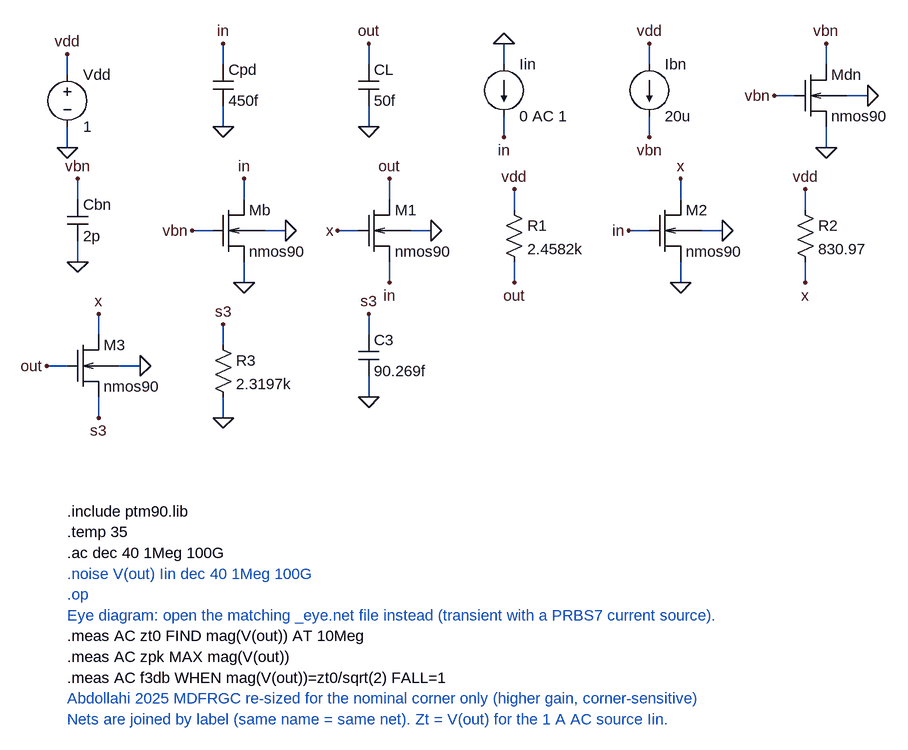
[diagram p0: schematic base_mdfrgc_nominal.asc]
base_mdfrgc_nominal.asc, the LTspice schematic file:
Version 4
SHEET 1 1600 1400
WIRE 0 16 0 -16
WIRE 0 96 0 128
WIRE 240 0 240 -32
WIRE 240 64 240 96
WIRE 464 0 464 -32
WIRE 464 64 464 96
WIRE 672 0 672 -32
WIRE 672 80 672 112
WIRE 896 0 896 -32
WIRE 896 80 896 112
WIRE 1168 0 1168 -32
WIRE 1120 48 1088 48
WIRE 1168 96 1168 128
WIRE 1200 48 1232 48
WIRE 16 208 16 176
WIRE 16 272 16 304
WIRE 272 208 272 176
WIRE 224 256 192 256
WIRE 272 304 272 336
WIRE 304 256 336 256
WIRE 496 208 496 176
WIRE 448 256 416 256
WIRE 496 304 496 336
WIRE 528 256 560 256
WIRE 688 224 688 192
WIRE 688 304 688 336
WIRE 944 208 944 176
WIRE 896 256 864 256
WIRE 944 304 944 336
WIRE 976 256 1008 256
WIRE 1136 224 1136 192
WIRE 1136 304 1136 336
WIRE 48 416 48 384
WIRE 0 464 -32 464
WIRE 48 512 48 544
WIRE 80 464 112 464
WIRE 240 432 240 400
WIRE 240 512 240 544
WIRE 464 416 464 384
WIRE 464 480 464 512
FLAG 0 -16 vdd
FLAG 0 128 0
FLAG 240 -32 in
FLAG 240 96 0
FLAG 464 -32 out
FLAG 464 96 0
FLAG 672 -32 0
FLAG 672 112 in
FLAG 896 -32 vdd
FLAG 896 112 vbn
FLAG 1168 -32 vbn
FLAG 1088 48 vbn
FLAG 1168 128 0
FLAG 1232 48 0
FLAG 16 176 vbn
FLAG 16 304 0
FLAG 272 176 in
FLAG 192 256 vbn
FLAG 272 336 0
FLAG 336 256 0
FLAG 496 176 out
FLAG 416 256 x
FLAG 496 336 in
FLAG 560 256 0
FLAG 688 192 vdd
FLAG 688 336 out
FLAG 944 176 x
FLAG 864 256 in
FLAG 944 336 0
FLAG 1008 256 0
FLAG 1136 192 vdd
FLAG 1136 336 x
FLAG 48 384 x
FLAG -32 464 out
FLAG 48 544 s3
FLAG 112 464 0
FLAG 240 400 s3
FLAG 240 544 0
FLAG 464 384 s3
FLAG 464 512 0
SYMBOL voltage 0 0 R0
SYMATTR InstName Vdd
SYMATTR Value 1
SYMBOL cap 224 0 R0
SYMATTR InstName Cpd
SYMATTR Value 450f
SYMBOL cap 448 0 R0
SYMATTR InstName CL
SYMATTR Value 50f
SYMBOL current 672 0 R0
SYMATTR InstName Iin
SYMATTR Value 0 AC 1
SYMBOL current 896 0 R0
SYMATTR InstName Ibn
SYMATTR Value 20u
SYMBOL tia_nmos4 1120 0 R0
SYMATTR InstName Mdn
SYMATTR Value nmos90
SYMATTR Value2 l=200n w=1u ad=0.2p as=0.2p pd=2.4u ps=2.4u
SYMBOL cap 0 208 R0
SYMATTR InstName Cbn
SYMATTR Value 2p
SYMBOL tia_nmos4 224 208 R0
SYMATTR InstName Mb
SYMATTR Value nmos90
SYMATTR Value2 l=200n w=7.995u ad=1.599p as=1.599p pd=16.39u ps=16.39u
SYMBOL tia_nmos4 448 208 R0
SYMATTR InstName M1
SYMATTR Value nmos90
SYMATTR Value2 l=100n w=6.663u ad=1.333p as=1.333p pd=13.73u ps=13.73u
SYMBOL res 672 208 R0
SYMATTR InstName R1
SYMATTR Value 2.4582k
SYMBOL tia_nmos4 896 208 R0
SYMATTR InstName M2
SYMATTR Value nmos90
SYMATTR Value2 l=100n w=30.35u ad=6.071p as=6.071p pd=61.11u ps=61.11u
SYMBOL res 1120 208 R0
SYMATTR InstName R2
SYMATTR Value 830.97
SYMBOL tia_nmos4 0 416 R0
SYMATTR InstName M3
SYMATTR Value nmos90
SYMATTR Value2 l=100n w=4.743u ad=0.9485p as=0.9485p pd=9.885u ps=9.885u
SYMBOL res 224 416 R0
SYMATTR InstName R3
SYMATTR Value 2.3197k
SYMBOL cap 448 416 R0
SYMATTR InstName C3
SYMATTR Value 90.269f
TEXT 0 688 Left 2 !.include ptm90.lib
TEXT 0 720 Left 2 !.temp 35
TEXT 0 752 Left 2 !.ac dec 40 1Meg 100G
TEXT 0 784 Left 2 ;.noise V(out) Iin dec 40 1Meg 100G
TEXT 0 816 Left 2 ;.op
TEXT 0 848 Left 2 ;Eye diagram: open the matching _eye.net file instead (transient with a PRBS7 current source).
TEXT 0 880 Left 2 !.meas AC zt0 FIND mag(V(out)) AT 10Meg
TEXT 0 912 Left 2 !.meas AC zpk MAX mag(V(out))
TEXT 0 944 Left 2 !.meas AC f3db WHEN mag(V(out))=zt0/sqrt(2) FALL=1
TEXT 0 976 Left 2 ;Abdollahi 2025 MDFRGC re-sized for the nominal corner only (higher gain, corner-sensitive)
TEXT 0 1008 Left 2 ;Nets are joined by label (same name = same net). Zt = V(out) for the 1 A AC source Iin.

The netlist it stands for:
* base_mdfrgc_nominal.asc
Vdd vdd 0 1
Cpd in 0 450f
CL out 0 50f
Iin 0 in 0 AC 1
Ibn vdd vbn 20u
Mdn vbn vbn 0 0 nmos90 l=200n w=1u ad=0.2p as=0.2p pd=2.4u ps=2.4u
Cbn vbn 0 2p
Mb in vbn 0 0 nmos90 l=200n w=7.995u ad=1.599p as=1.599p pd=16.39u ps=16.39u
M1 out x in 0 nmos90 l=100n w=6.663u ad=1.333p as=1.333p pd=13.73u ps=13.73u
R1 vdd out 2.4582k
M2 x in 0 0 nmos90 l=100n w=30.35u ad=6.071p as=6.071p pd=61.11u ps=61.11u
R2 vdd x 830.97
M3 x out s3 0 nmos90 l=100n w=4.743u ad=0.9485p as=0.9485p pd=9.885u ps=9.885u
R3 s3 0 2.3197k
C3 s3 0 90.269f
.model NMOS NMOS
.model PMOS PMOS
.lib standard.mos
.include ptm90.lib
.temp 35
.ac dec 40 1Meg 100G
* .noise V(out) Iin dec 40 1Meg 100G
* .op
* Eye diagram: open the matching _eye.net file instead (transient with a PRBS7 current source).
.meas AC zt0 FIND mag(V(out)) AT 10Meg
.meas AC zpk MAX mag(V(out))
.meas AC f3db WHEN mag(V(out))=zt0/sqrt(2) FALL=1
* Abdollahi 2025 MDFRGC re-sized for the nominal corner only (higher gain, corner-sensitive)
* Nets are joined by label (same name = same net). Zt = V(out) for the 1 A AC source Iin.
.backanno
.end